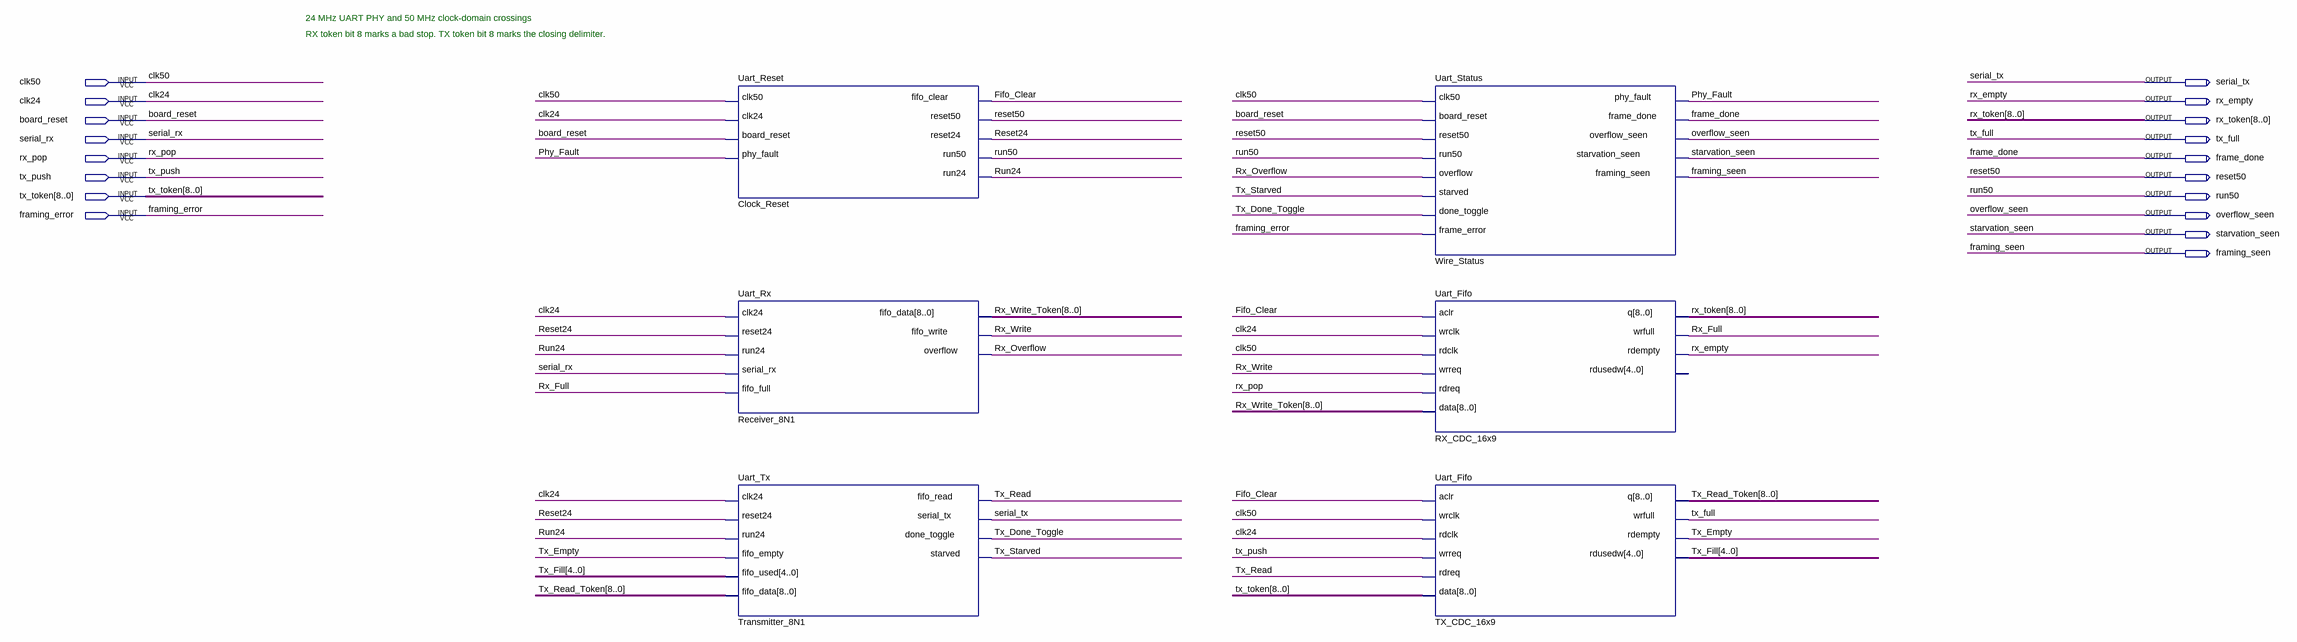
[diagram p0: schematic sheet]
// Quartus schematic UART_PHY.bdf as structural Verilog: 6 symbols, 18 pins
module UART_PHY (
  input  clk50,
  input  clk24,
  input  board_reset,
  input  serial_rx,
  input  rx_pop,
  input  tx_push,
  input  [8:0] tx_token,
  input  framing_error,
  output serial_tx,
  output rx_empty,
  output [8:0] rx_token,
  output tx_full,
  output frame_done,
  output reset50,
  output run50,
  output overflow_seen,
  output starvation_seen,
  output framing_seen
);

  wire Fifo_Clear, Phy_Fault, Reset24, Run24, Rx_Full, Rx_Overflow, Rx_Write, Tx_Done_Toggle, Tx_Empty,
       Tx_Read, Tx_Starved;
  wire [4:0] Tx_Fill;
  wire [8:0] Rx_Write_Token, Tx_Read_Token;

  Uart_Reset Clock_Reset (
    .clk50(clk50), .clk24(clk24), .board_reset(board_reset), .phy_fault(Phy_Fault), .fifo_clear(Fifo_Clear),
    .reset50(reset50), .reset24(Reset24), .run50(run50), .run24(Run24));
  Uart_Rx Receiver_8N1 (
    .clk24(clk24), .reset24(Reset24), .run24(Run24), .serial_rx(serial_rx), .fifo_full(Rx_Full),
    .fifo_data(Rx_Write_Token), .fifo_write(Rx_Write), .overflow(Rx_Overflow));
  Uart_Tx Transmitter_8N1 (
    .clk24(clk24), .reset24(Reset24), .run24(Run24), .fifo_empty(Tx_Empty), .fifo_used(Tx_Fill),
    .fifo_data(Tx_Read_Token), .fifo_read(Tx_Read), .serial_tx(serial_tx), .done_toggle(Tx_Done_Toggle),
    .starved(Tx_Starved));
  Uart_Status Wire_Status (
    .clk50(clk50), .board_reset(board_reset), .reset50(reset50), .run50(run50), .overflow(Rx_Overflow),
    .starved(Tx_Starved), .done_toggle(Tx_Done_Toggle), .frame_error(framing_error), .phy_fault(Phy_Fault),
    .frame_done(frame_done), .overflow_seen(overflow_seen), .starvation_seen(starvation_seen),
    .framing_seen(framing_seen));
  Uart_Fifo RX_CDC_16x9 (
    .aclr(Fifo_Clear), .wrclk(clk24), .rdclk(clk50), .wrreq(Rx_Write), .rdreq(rx_pop), .data(Rx_Write_Token),
    .q(rx_token), .wrfull(Rx_Full), .rdempty(rx_empty));  // open: rdusedw
  Uart_Fifo TX_CDC_16x9 (
    .aclr(Fifo_Clear), .wrclk(clk50), .rdclk(clk24), .wrreq(tx_push), .rdreq(Tx_Read), .data(tx_token),
    .q(Tx_Read_Token), .wrfull(tx_full), .rdempty(Tx_Empty), .rdusedw(Tx_Fill));

  // Notes on the sheet:
  //   24 MHz UART PHY and 50 MHz clock-domain crossings
  //   RX token bit 8 marks a bad stop. TX token bit 8 marks the closing delimiter.
endmodule
